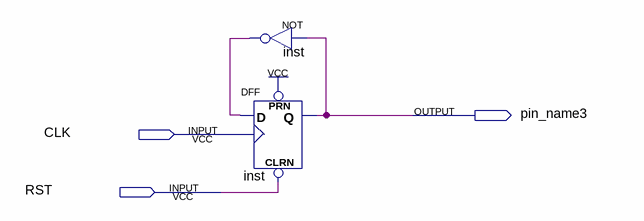
[diagram p0: schematic sheet]
// Quartus schematic PRESETFFDIVISOR.bdf as structural Verilog: 2 symbols, 3 pins
module PRESETFFDIVISOR (
  input  CLK,
  input  RST,
  output pin_name3
);

  wire inst_out;

  not inst (inst_out, pin_name3);
  DFF inst_dup2 (.CLRN(RST), .CLK(CLK), .D(inst_out), .PRN(1'b1), .Q(pin_name3));
endmodule
